# Altium project Power_Channel.PrjPcb
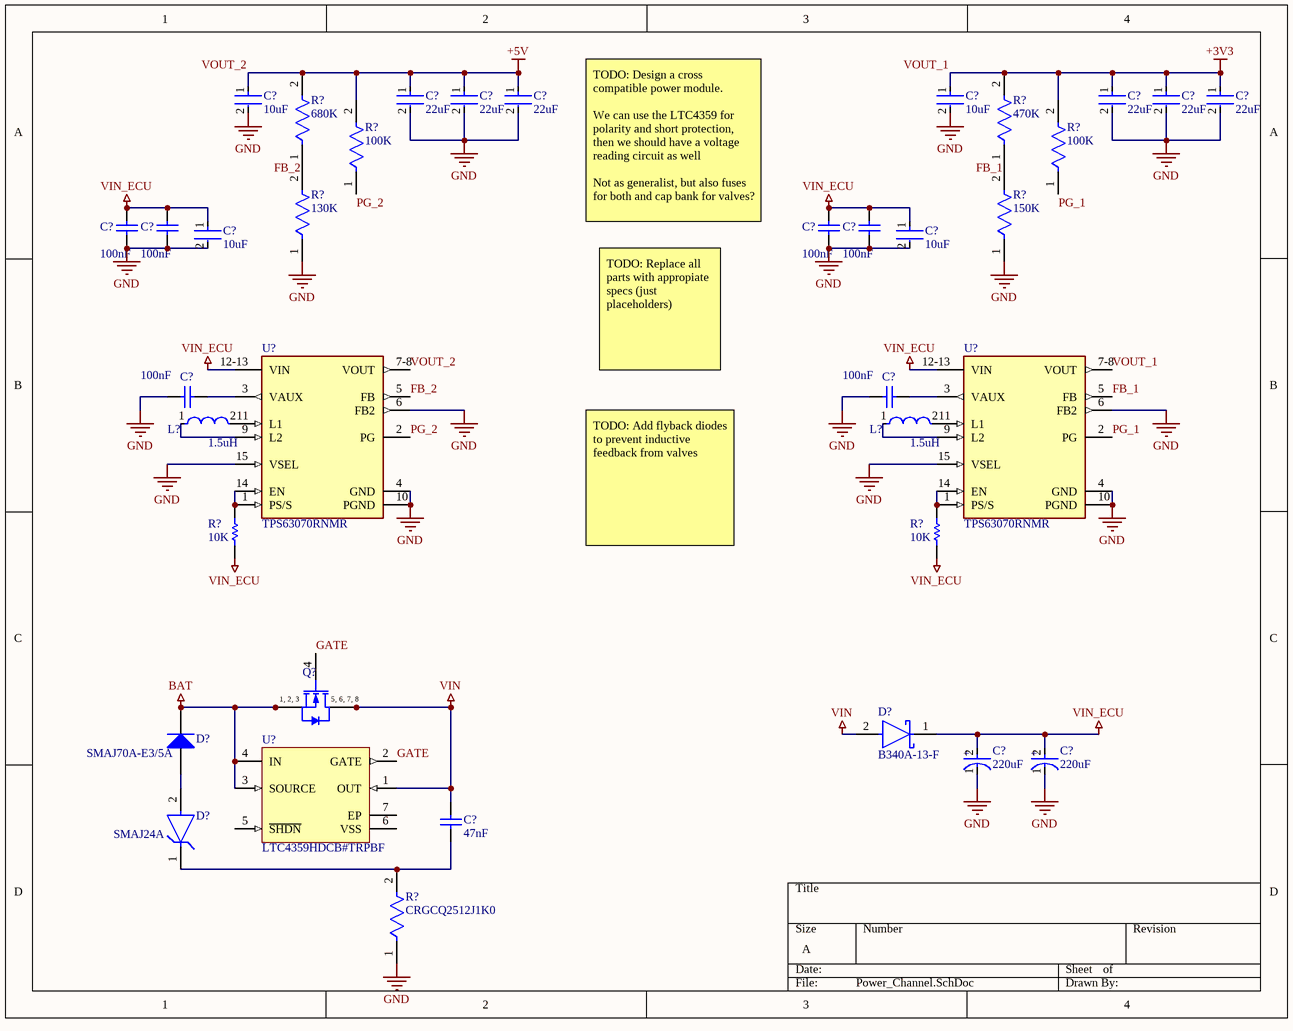
[diagram p0: Power_Channel.SchDoc]
1 sheet, 37 parts. Net scope: global (net labels, ports and power ports of the same name join across sheets).

## Sheet Power_Channel.SchDoc
size A; SheetNumber: 1; SheetTotal: 1

### Parts
(Parts that share a designator on the sheet are numbered #1, #2 ... from top to bottom, then left to right.)
C?#1  10uF  [FP-ZRB15X-0_22-MFG]
C?#2  22uF  [FP-GCJ31C-0_3-MFG]
C?#3  22uF  [FP-GCJ31C-0_3-MFG]
C?#4  22uF  [FP-GCJ31C-0_3-MFG]
C?#5  10uF  [FP-ZRB15X-0_22-MFG]
C?#6  22uF  [FP-GCJ31C-0_3-MFG]
C?#7  22uF  [FP-GCJ31C-0_3-MFG]
C?#8  22uF  [FP-GCJ31C-0_3-MFG]
C?#9  10uF  [FP-ZRB15X-0_22-MFG]
C?#10  10uF  [FP-ZRB15X-0_22-MFG]
C?#11  100nF  [CAPC1005X60X30NL05T10]
C?#12  100nF  [CAPC1005X60X30NL05T10]
C?#13  100nF  [CAPC1005X60X30NL05T10]
C?#14  100nF  [CAPC1005X60X30NL05T10]
C?#15  100nF  [CAPC1005X60X30NL05T10]
C?#16  100nF  [CAPC1005X60X30NL05T10]
C?#17  220uF  [FP-OS-CON-SMT-B6-MFG]
C?#18  220uF  [FP-OS-CON-SMT-B6-MFG]
C?#19  47nF  [CAPC1812(4532)125_N]
D?#1  B340A-13-F  [FP-SMA-MFG]
D?#2  SMAJ70A-E3/5A  [VISH-DO-214AC-2_M]
D?#3  SMAJ24A  [FP-SMAJ-MFG]
L?#1  1.5uH  [FP-MLP2012M-IPC_B]
L?#2  1.5uH  [FP-MLP2012M-IPC_B]
Q?  BSC028N06NS  [INF-PG-TDSON-8-1_V]  (value not drawn)
R?#1  680K  [FP-CRGCQ2512-IPC_C]
R?#2  470K  [FP-CRGCQ1210-IPC_C]
R?#3  100K  [FP-CRGCQ2512-IPC_C]
R?#4  100K  [FP-CRGCQ2512-IPC_C]
R?#5  130K  [FP-RN732A-MFG]
R?#6  150K  [FP-CRGCQ1210-IPC_C]
R?#7  10K  [RESC0603X26X15LL03T05]
R?#8  10K  [RESC0603X26X15LL03T05]
R?#9  CRGCQ2512J1K0  [FP-CRGCQ2512-IPC_C]
U?#1  TPS63070RNMR  [FP-RNM0015A-MFG]
U?#2  TPS63070RNMR  [FP-RNM0015A-MFG]
U?#3  LTC4359HDCB#TRPBF  [LT-DCB-6_V]

### Nets
BAT: D?#2.1(K) Q?.1(SOURCE) Q?.2(SOURCE) Q?.3(SOURCE) U?#3.3(SOURCE) U?#3.4(IN)
GND: C?#1.2 C?#2.2 C?#3.2 C?#4.2 C?#5.2 C?#6.2 C?#7.2 C?#8.2 C?#9.2 C?#10.2 C?#11.1 C?#12.1 C?#13.1 C?#14.1 C?#15.2 C?#16.2 C?#17.1(C) C?#18.1(C) R?#5.1 R?#6.1 R?#9.1 U?#1.4(GND) U?#1.6(FB2) U?#1.10(PGND) U?#1.15(VSEL) U?#2.4(GND) U?#2.6(FB2) U?#2.10(PGND) U?#2.15(VSEL)
VIN: C?#19.2 D?#1.2(A) Q?.5(DRAIN) Q?.6(DRAIN) Q?.7(DRAIN) Q?.8(DRAIN) U?#3.1(OUT)
VIN_ECU: C?#9.1 C?#10.1 C?#11.2 C?#12.2 C?#13.2 C?#14.2 C?#17.2(A) C?#18.2(A) D?#1.1(C) R?#7.1 R?#8.1 U?#1.12-13(VIN) U?#2.12-13(VIN)
VOUT_1: C?#5.1 C?#6.1 C?#7.1 C?#8.1 R?#2.2 R?#4.2 U?#2.7-8(VOUT)  [also labelled +3V3]
VOUT_2: C?#1.1 C?#2.1 C?#3.1 C?#4.1 R?#1.2 R?#3.2 U?#1.7-8(VOUT)  [also labelled +5V]
FB_1: R?#2.1 R?#6.2 U?#2.5(FB)
FB_2: R?#1.1 R?#5.2 U?#1.5(FB)
GATE: Q?.4(GATE) U?#3.2(GATE)
PG_1: R?#4.1 U?#2.2(PG)
PG_2: R?#3.1 U?#1.2(PG)
NetC?#15_1: C?#15.1 U?#1.3(VAUX)
NetC?#16_1: C?#16.1 U?#2.3(VAUX)
NetC?#19_1: C?#19.1 D?#3.1(C) R?#9.2
NetD?#2_2: D?#2.2(A) D?#3.2(A)
NetL?#1_1: L?#1.1 U?#1.9(L2)
NetL?#1_2: L?#1.2 U?#1.11(L1)
NetL?#2_1: L?#2.1 U?#2.9(L2)
NetL?#2_2: L?#2.2 U?#2.11(L1)
NetR?#7_2: R?#7.2 U?#1.1(PS/S) U?#1.14(EN)
NetR?#8_2: R?#8.2 U?#2.1(PS/S) U?#2.14(EN)

Not connected (* = marked no-connect by the designer): U?#3 5(~{SHDN}) 6(VSS) 7(EP)

### Notes on the sheet
- TODO: Design a cross compatible power module.
  We can use the LTC4359 for polarity and short protection, then we should have a voltage reading circuit as well
  Not as generalist, but also fuses for both and cap bank for valves?
- TODO: Replace all parts with appropiate specs (just placeholders)
- TODO: Add flyback diodes to prevent inductive feedback from valves
- (in symbol CMP-1091-00043-1) 1, 2, 3; 5, 6, 7, 8
- (in symbol CMP-05428-000125-1) +

### Library data of the parts
C?#1 C?#5 C?#9 C?#10 = CMP-06035-063245-1: Multilayer Ceramic Capacitors on Interposer Board for General Purpose 10μF ±20% 4VDC X6S  SMD  0402
C?#2-C?#4 C?#6-C?#8 = CMP-06035-003359-1: Cap Ceramic 22uF 10V X7R 20% Pad SMD 1206 Soft Termination  +125°C Automotive T/R
C?#11-C?#16 = CMP-2008-02091-2: Manufacturer: Kemet; Part Number: C0402C104K9PACTU
C?#17 C?#18 = CMP-05428-000125-1: Conductive Polymer Aluminum Solid Capacitors (OS-CON) 220uF ±20% 6.3V; Ripple Current (AC): 3.15A; Polarity: Polar; Life (Hours): 2000Hour; ESR (Equivalent Series Resistance): 15mR; Leakage Current: 500uA; Dissipation Factor: 12%; Termination: SMD/SMT; Series: OS-CON, SVPE; Diameter: 5mm; Height - Seated (Max): 0.236inch; Number of Pins: 6; Max Operating Temperature: 105°C; Lead Free: Lead Free; Voltage: 6.3V; RoHS Compliant: Yes; Voltage Rating: 6.3V; Package Quantity: 1000; Height: 5.9mm; REACH SVHC: No SVHC; Capacitance: 220uF; Tolerance: 20%; Packaging: Tape and Reel; Min Operating Temperature: -55°C; Voltage Rating (DC): 6.3V; Construction: Cylindrical; Ripple Current: 3.15A; Case/Package: Radial; Length: 5.9mm; Mount: Surface Mount
C?#19 = CMP-1040-01133-1: CAP 47nF 25V ±5% 1812 (4532 Metric) Thickness 1.25mm SMD; Case-Metric: 4532; Case-EIA: 1812; Tolerance: Â±5%; Value: 47nF; Technology: SMT; Max Thickness: 1.25 mm; Rated Voltage: 25 V
D?#1 = CMP-1667-00003-3: DIODE SCHOTTKY 40V 3A SMA; Max Forward Surge Current (Ifsm): 80A; Forward Voltage: 500mV; Polarity: Standard; Max Reverse Current: 500uA; Capacitance: 250pF; Element Configuration: Single; Mount: Surface Mount; Output Current: 3A; Radiation Hardening: No; Width: 2.92mm; Current Rating: 3A; Termination: SMD/SMT; Voltage: 40V; Series: -; Max Operating Temperature: 125°C; Current: 3A; Max Repetitive Reverse Voltage (Vrrm): 40V; Min Operating Temperature: -55°C; REACH SVHC: No SVHC; Number of Pins: 2; Average Rectified Current: 3A; Contact Plating: Tin; RoHS Compliant: Yes; Max Reverse Voltage (DC): 40V; Packaging: Tape and Reel; Height: 2.3mm; Length: 4.6mm; Case/Package: SMA; Weight: 0.002258oz; Peak Non-Repetitive Surge Current: 80A; Package Quantity: 5000; Lead Free: Lead Free; Forward Current: 3A; Voltage Rating (DC): 40V
D?#2 = CMP-0548-00328-2: Transient Voltage Suppressor, 6.40 to 231 V, 70 V Stand-off Voltage, Uni-Directional, -55 to 155 degC, 2-pin DO-214AC, Pb-Free, Tape and Reel; Manufacturer: Vishay Semiconductor; VWM (V): 70; VBR Uni-Directional (V): 6.4 to 231; ID (uA): 1; IFSM: 40 A; PPPM (W): 400, 300; Mounting Technology: Surface Mount; RoHS: TRUE; ComponentLink1Description: Manufacturer URL; ComponentLink1URL: http://www.vishay.com/; PartNumber: SMAJ70A-E3/5A; Operating Junction and Storage Temperature Range: -55 to 150 degC; PackageDescription: 2-Pin DO-214AC (SMA), Body 4.245 x 2.665 mm; DatasheetVersion: 12/8/2013; ComponentLink3URL: http://www.vishay.com/docs/88390/smaj50a.pdf; ComponentLink2URL: http://www.vishay.com/docs/88390/smaj50a.pdf; Packing: Tape and Reel; ComponentLink3Description: Package Specification; PackageReference: DO-214AC-2; ComponentLink2Description: Datasheet
D?#3 = CMP-08607-000085-1: TVS DIODE 24V 38.9V DO214AC; Manufacturer: Littelfuse Inc; Direction: Unidirectional; Peak Pulse Power: 400W; Peak Pulse Current: 10.3A; Max Junction Temp: +150°C; Breakdown Voltage: 26.7V; Number Of Channels: 1; ComponentLink2Description: Datasheet; Device Class L3: unset; Height: 2.29mm; ComponentLink2URL: https://www.littelfuse.com/~/media/electronics/datasheets/tvs_diodes/littelfuse_tvs_diode_smaj_datasheet.pdf.pdf; Device Class L1: Circuit Protection; Package: SMAJ; Temperature Range High: +150°C; Device Class L2: TVS Diodes; Clamping Voltage: 38.9V; Reverse Standoff Voltage: 24V; Manufacturer Part Number: SMAJ24A; Mouser Description: In a Pack of 25, Littelfuse SMAJ24A, Uni-Directional TVS Diode, 400W, 2-Pin DO-214AC; Digikey Description: TVS DIODE 24V 38.9V DO214AC; Lead Free: Yes; Octopart: https://octopart.com/smaj24a-littelfuse-350003; Automotive: No; Temperature Range Low: -65°C; Category: Diode; RoHS: TRUE; Temperature: -65°C to +150°C
L?#1 L?#2 = CMP-08253-000155-1: Shielded Multilayer Inductor 1.5uH ±20% 1000mA 208mΩ SMD 0805; DC Resistance (DCR): 208mR; Test Frequency: 2MHz; Core Material: Ferrite; Current Rating: 1A; RoHS Compliant: Yes; Max Operating Temperature: 125°C; Case/Package: 0805; Case Code (Metric): 2012; Package Quantity: 4000; Packaging: Tape and Reel; Min Operating Temperature: -40°C; Inductance: 1.5uH; Tolerance: 20%; Width: 0.049inch; Mount: Surface Mount; Shielding: Shielded; Length: 0.079inch; Height - Seated (Max): 0.039inch; Case Code (Imperial): 0805
Q? = CMP-1091-00043-1: N-Channel OptiMOS Power-Transistor, 60 V VDS, 100 A ID, -55 to 150 degC, PG-TDSON-8-1, Reel, Green; Manufacturer: Infineon; Green: TRUE; ID (max): 100Â A; RthJA (max): 50 K/W; IDpuls (max): 400Â A; VGS(th) (min): 2.1Â V; Ptot (max): 83Â W; RthJC (max): 1.5Â K/W; VDS (max): 60Â V; Polarity: N; QG: 37Â nC; VGS(th) (max): 3.3 V; RDS (on) (max): 2.8Â mOhm; ComponentLink3Description: Package Specification; ComponentLink2URL: http://www.infineon.com/dgdl/BSC028N06NS_Rev2.1.pdf?folderId=db3a30431ddc9372011ebafa04517f8b&fileId=db3a3043345a30bc013465d221bd62f9; Packing: Reel; PackageReference: PG-TDSON-8-1; PackageDescription: 8-Pin Plastic (Green) Thin Dual Small Outline Non-Leaded Package, 5.15 x 5.9 mm Body, 1.27 mm Pitch; ComponentLink1Description: Manufacturer URL; ComponentLink1URL: http://www.infineon.com/; PartNumber: BSC028N06NS; DatasheetVersion: Rev. 2.1; Mounting Technology: Surface Mount; ComponentLink2Description: Datasheet; ComponentLink3URL: http://www.infineon.com/cms/packages/SMD_-_Surface_Mounted_Devices/P-PG-TDSON/P-PG-TDSON-08-01x_2x_3.html?__locale=en; Halogen-free: TRUE; Rth: 1.5Â K/W
R?#1 = CMP-03211-001765-1: CRGCQ2512 680KΩ 1W ±100ppm/°C 5%200V; Manufacturer Part Number: CRGCQ2512J680K; Manufacturer: TE Connectivity; Voltage Rating: 200V; Tolerance: 0.05; Automotive Grade: Grade 0; Lead Free: Yes; Device Class L3: Chip SMD Resistors; Category: Res; Resistance: 680KΩ; Octopart: https://octopart.com/crgcq2512j680k-te+connectivity-91018651; Composition: Thick Film; Package: CRGCQ2512; Series: CRGCQ; Value: 680KΩ; ComponentLink2Description: Datasheet; RoHS: TRUE; Automotive: Yes; Power Rating: 1W; Device Class L1: Passive Components; Temperature Range Low: -55°C; Height: 0.65mm; ComponentLink2URL: https://www.te.com/commerce/DocumentDelivery/DDEController?Action=showdoc&DocId=Data+Sheet%7F1773204-3%7F1%7Fpdf%7FEnglish%7FENG_DS_1773204-3_1.pdf%7F4-2176349-1341; Temperature Range High: +155°C; Temperature: -55°C to +155°C; Device Class L2: Resistors; Temperature Coefficient: ±100ppm/°C; Ipc Land Pattern Name: RESC635320X55
R?#2 = CMP-03211-006432-1: CRGCQ 1210 470K 5%; Manufacturer: TE Connectivity; Manufacturer Part Number: CRGCQ1210J470K; Value: 470KΩ; Temperature Coefficient: ±100ppm/°C; Power Rating: 0.5W; Tolerance: 0.05; Description: CRGCQ1210 470KΩ 0.5W ±100ppm/°C 5% 200V; Voltage Rating: 200V; Temperature: -55°C to +155°C; Package: CRGCQ1210; Series: CRGCQ; Category: Res; Device Class L1: Passive Components; Lead Free: Yes; Digikey Description: CRGCQ 1210 470K 5%; Temperature Range High: +155°C; Height: 0.65mm; Resistance: 470KΩ; Composition: Thick Film; Octopart: https://octopart.com/crgcq1210j470k-te+connectivity-91018436; Temperature Range Low: -55°C; RoHS: TRUE; Automotive: Yes; ComponentLink2URL: https://www.te.com/commerce/DocumentDelivery/DDEController?Action=showdoc&DocId=Data+Sheet%7F1773204-3%7F1%7Fpdf%7FEnglish%7FENG_DS_1773204-3_1.pdf%7F4-2176347-1303; Device Class L2: Resistors; Automotive Grade: Grade 1294; ComponentLink2Description: Datasheet; Device Class L3: Chip SMD Resistors; Ipc Land Pattern Name: RESC310260X55; Ambient Temperature Range High: +70°C
R?#3 R?#4 = CMP-03211-002138-1: CRGCQ2512 100KΩ 1W ±100ppm/°C 1%200V; Manufacturer Part Number: CRGCQ2512F100K; Manufacturer: TE Connectivity; Voltage Rating: 200V; Tolerance: 0.01; Automotive Grade: Grade 0; Temperature Coefficient: ±100ppm/°C; Temperature Range High: +155°C; Lead Free: Yes; Device Class L2: Resistors; Temperature Range Low: -55°C; Automotive: Yes; Package: CRGCQ2512; RoHS: TRUE; Octopart: https://octopart.com/crgcq2512f100k-te+connectivity-91018554; Device Class L1: Passive Components; Height: 0.65mm; Category: Res; Value: 100KΩ; Temperature: -55°C to +155°C; Ipc Land Pattern Name: RESC635320X55; Device Class L3: Chip SMD Resistors; ComponentLink2URL: https://www.te.com/commerce/DocumentDelivery/DDEController?Action=showdoc&DocId=Data+Sheet%7F1773204-3%7F1%7Fpdf%7FEnglish%7FENG_DS_1773204-3_1.pdf%7F4-2176349-1150; Power Rating: 1W; ComponentLink2Description: Datasheet; Series: CRGCQ; Resistance: 100KΩ; Composition: Thick Film
R?#5 = CMP-03211-005013-1: SMD Chip Resistor, Thin Film, 130KΩ, 100 V, 0805 [2012 Metric], 100 mW, 0.1%, RN73 Series; Manufacturer: TE Connectivity; Manufacturer Part Number: RN73C2A130KB; Voltage Rating: 100V; Temperature Coefficient: 10ppm/°C; Power Rating: 0.1W; Temperature: -55°C to 155°C; Device Class L3: Chip SMD Resistors; octopart_url: https://octopart.com/rn73c2a130kb-te+connectivity-47108236; Device Class L1: Passive Components; Ipc Land Pattern Name: RESC200125X55; Composition: Thin Film; Resistance: 130KΩ; ComponentLink2Description: Datasheet; RoHS: TRUE; Automotive: No; Temperature Range Low: -55°C; Tolerance: 0.1%; Category: Res; Value: 130KΩ; Temperature Range High: 155°C; ComponentLink2URL: https://www.te.com/commerce/DocumentDelivery/DDEController?Action=showdoc&DocId=Data+Sheet%7F1773270%7FP%7Fpdf%7FEnglish%7FENG_DS_1773270_P.pdf%7F1676162-2; Device Class L2: Resistors; Series: RN73; Height: 0.65mm; Package: RN732A; Lead Free: Yes; Octopart: https://octopart.com/rn73c2a130kb-te+connectivity-47108236; packaging: Custom
R?#6 = CMP-03211-001093-1: CRGCQ1210 150KΩ 0.5W ±100ppm/°C 1% 200V; Manufacturer: TE Connectivity; Manufacturer Part Number: CRGCQ1210F150K; Tolerance: 0.01; Temperature Coefficient: ±100ppm/°C; Ambient Temperature Range High: +70°C; Octopart: https://octopart.com/crgcq1210f150k-te+connectivity-91018354; Power Rating: 0.5W; Category: Res; Automotive: Yes; Height: 0.65mm; Temperature Range High: +155°C; Automotive Grade: Grade 1177; Lead Free: Yes; Value: 150KΩ; Device Class L1: Passive Components; Voltage Rating: 200V; Series: CRGCQ; Ipc Land Pattern Name: RESC310260X55; Temperature Range Low: -55°C; RoHS: TRUE; Composition: Thick Film; ComponentLink2URL: https://www.te.com/commerce/DocumentDelivery/DDEController?Action=showdoc&DocId=Data+Sheet%7F1773204-3%7F1%7Fpdf%7FEnglish%7FENG_DS_1773204-3_1.pdf%7F4-2176347-1186; Resistance: 150KΩ; Device Class L3: Chip SMD Resistors; ComponentLink2Description: Datasheet; Package: CRGCQ1210; Temperature: -55°C to +155°C; Device Class L2: Resistors
R?#7 R?#8 = CMP-2004-03568-1: Manufacturer: TE Connectivity / AMP; Part Number: CRG0201F10K
R?#9 = CMP-03211-001519-1: CRGCQ2512 1KΩ 1W ±100ppm/°C 5%200V; Manufacturer: TE Connectivity; Tolerance: 0.05; Voltage Rating: 200V; Automotive Grade: Grade 0; ComponentLink2Description: Datasheet; ComponentLink2URL: https://www.te.com/commerce/DocumentDelivery/DDEController?Action=showdoc&DocId=Data+Sheet%7F1773204-3%7F1%7Fpdf%7FEnglish%7FENG_DS_1773204-3_1.pdf%7F4-2176349-695; Automotive: Yes; RoHS: TRUE; Temperature Coefficient: ±100ppm/°C; Value: 1KΩ; Temperature: -55°C to +155°C; Composition: Thick Film; Lead Free: Yes; Resistance: 1KΩ; Octopart: https://octopart.com/crgcq2512j1k0-te+connectivity-91018624; Manufacturer Part Number: CRGCQ2512J1K0; Ipc Land Pattern Name: RESC635320X55; Power Rating: 1W; Height: 0.65mm; Temperature Range High: +155°C; Device Class L1: Passive Components; Device Class L3: Chip SMD Resistors; Package: CRGCQ2512; Device Class L2: Resistors; Series: CRGCQ; Temperature Range Low: -55°C; Category: Res
U?#1 U?#2 = CMP-04918-000409-1: IC REG BCK BST ADJ 3.6A 15VQFN; Synchronous Rectifier: Yes; Output Type: Adjustable; Output Current: 2A; Max Input Voltage: 16V; Switching Frequency: 2.4MHz; Min Output Voltage: 2.5V; Output Configuration: Positive; Min Input Voltage: 2V; Topology: Buck-Boost; Number of Outputs: 1; Max Output Voltage: 9V; Quiescent Current: 50uA; Max Operating Temperature: 125°C; Case/Package: VQFN; Number of Pins: 15; RoHS Compliant: Yes; Mount: Surface Mount; Min Operating Temperature: -40°C; Lead Free: Lead Free; Packaging: Tape and Reel
U?#3 = CMP-0479-00005-1: Ideal Diode Controller with Reverse Input Protection, 4 to 80 V Vin, 6-pin SON (DCB-6), -40 to 125 degC, Pb-Free, Tape and Reel; Manufacturer: Linear Technology; Ideal Diode: Single, External, N-Channel; Mounting Technology: Surface Mount; ComponentLink2URL: http://cds.linear.com/docs/en/datasheet/4359f.pdf; ComponentLink1Description: Manufacturer URL; PackageReference: DCB-6; ComponentLink2Description: Datasheet; Packing: Tape and Reel; RoHS: TRUE; ComponentLink3URL: http://www.linear.com/docs/en/packaging/(DCB6)%20DFN%2005-08-1715%20Rev%20A.pdf; PartNumber: LTC4359HDCB#TRPBF; ComponentLink1URL: http://www.linear.com/; PackageDescription: 6-Pin Plastic DFN, Body 2 x 3 mm, Pitch 0.5 mm; PackageVersion: Rev. A, 03/2011; Code_JEDEC: MO-229; ComponentLink3Description: Package Specification